# EasyEDA Pro project car_dianci.eprj

# Schematic Schematic1
Create Date: 2024-03-31; Page Name: P1; Project Name: car_dianci; Schematic Name: Schematic1; Update Date: 2024-04-11; Company: 嘉立创EDA; Page Size: A4; Version: V1.0
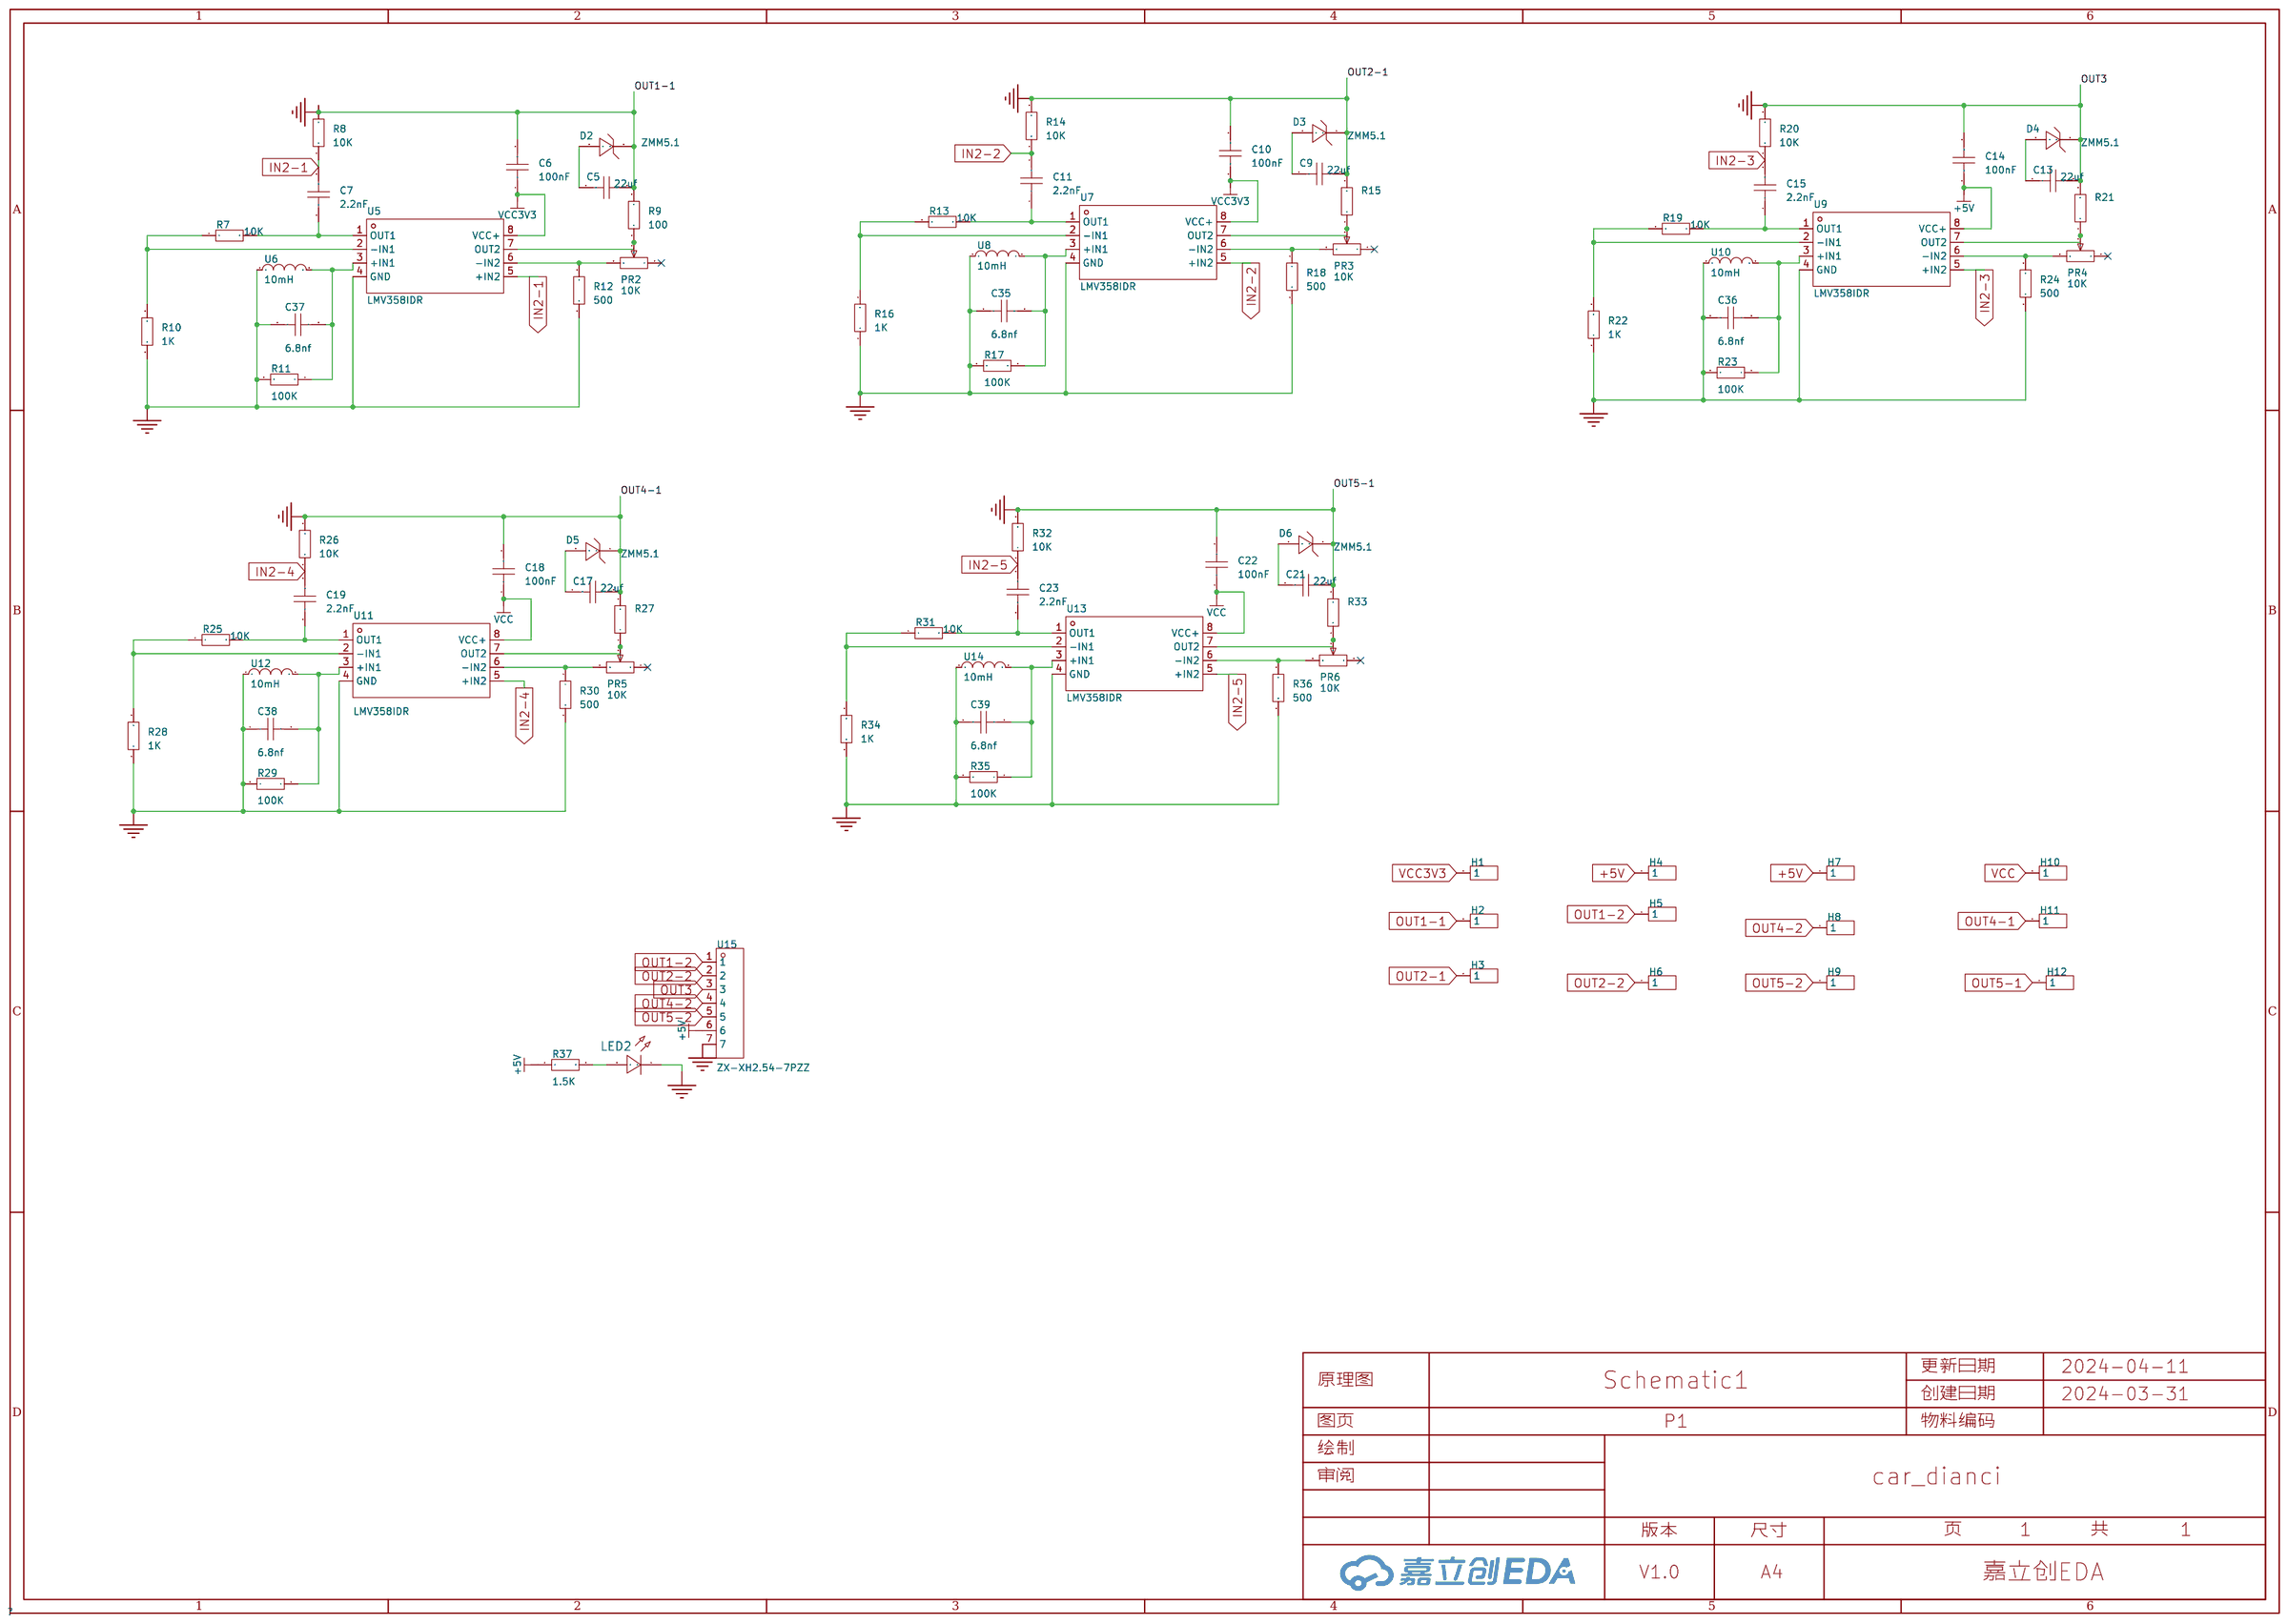
[diagram p0: schematic sheet]

## Parts
C5  22uf  [C0805]
C6  100nF  [C0805]
C7  2.2nF  [C0805]
C9  22uf  [C0805]
C10  100nF  [C0805]
C11  2.2nF  [C0805]
C13  22uf  [C0805]
C14  100nF  [C0805]
C15  2.2nF  [C0805]
C17  22uf  [C0805]
C18  100nF  [C0805]
C19  2.2nF  [C0805]
C21  22uf  [C0805]
C22  100nF  [C0805]
C23  2.2nF  [C0805]
C35  6.8nf  [CAP-TH_L7.2-W5.0-P5.00-D1.0]
C36  6.8nf  [CAP-TH_L7.2-W5.0-P5.00-D1.0]
C37  6.8nf  [CAP-TH_L7.2-W5.0-P5.00-D1.0]
C38  6.8nf  [CAP-TH_L7.2-W5.0-P5.00-D1.0]
C39  6.8nf  [CAP-TH_L7.2-W5.0-P5.00-D1.0]
D2  ZMM5.1  [SOD-80_L3.5-W1.5-RD]
D3  ZMM5.1  [SOD-80_L3.5-W1.5-RD]
D4  ZMM5.1  [SOD-80_L3.5-W1.5-RD]
D5  ZMM5.1  [SOD-80_L3.5-W1.5-RD]
D6  ZMM5.1  [SOD-80_L3.5-W1.5-RD]
H1  -  [HDR-TH_1P-V-M_XKB_X4611WV-01I-C28D40]
H2  -  [HDR-TH_1P-V-M_XKB_X4611WV-01I-C28D40]
H3  -  [HDR-TH_1P-V-M_XKB_X4611WV-01I-C28D40]
H4  -  [HDR-TH_1P-V-M_XKB_X4611WV-01I-C28D40]
H5  -  [HDR-TH_1P-V-M_XKB_X4611WV-01I-C28D40]
H6  -  [HDR-TH_1P-V-M_XKB_X4611WV-01I-C28D40]
H7  -  [HDR-TH_1P-V-M_XKB_X4611WV-01I-C28D40]
H8  -  [HDR-TH_1P-V-M_XKB_X4611WV-01I-C28D40]
H9  -  [HDR-TH_1P-V-M_XKB_X4611WV-01I-C28D40]
H10  -  [HDR-TH_1P-V-M_XKB_X4611WV-01I-C28D40]
H11  -  [HDR-TH_1P-V-M_XKB_X4611WV-01I-C28D40]
H12  -  [HDR-TH_1P-V-M_XKB_X4611WV-01I-C28D40]
LED2  -  [LED_0805]
PR2  10K  [R_3386P]
PR3  10K  [R_3386P]
PR4  10K  [R_3386P]
PR5  10K  [R_3386P]
PR6  10K  [R_3386P]
R7  10K  [R0805]
R8  10K  [R0805]
R9  100  [R0805]
R10  1K  [R0805]
R11  100K  [R0805]
R12  500  [R0805]
R13  10K  [R0805]
R14  10K  [R0805]
R15  100  [R0805]
R16  1K  [R0805]
R17  100K  [R0805]
R18  500  [R0805]
R19  10K  [R0805]
R20  10K  [R0805]
R21  100  [R0805]
R22  1K  [R0805]
R23  100K  [R0805]
R24  500  [R0805]
R25  10K  [R0805]
R26  10K  [R0805]
R27  100  [R0805]
R28  1K  [R0805]
R29  100K  [R0805]
R30  500  [R0805]
R31  10K  [R0805]
R32  10K  [R0805]
R33  100  [R0805]
R34  1K  [R0805]
R35  100K  [R0805]
R36  500  [R0805]
R37  1.5K  [R0805]
U5  LMV358IDR  [SOIC-8_L4.9-W3.9-P1.27-LS6.0-BL]
U6  10mH  [IND-TH_BD10.0-P5.00-D0.6]
U7  LMV358IDR  [SOIC-8_L4.9-W3.9-P1.27-LS6.0-BL]
U8  10mH  [IND-TH_BD10.0-P5.00-D0.6]
U9  LMV358IDR  [SOIC-8_L4.9-W3.9-P1.27-LS6.0-BL]
U10  10mH  [IND-TH_BD10.0-P5.00-D0.6]
U11  LMV358IDR  [SOIC-8_L4.9-W3.9-P1.27-LS6.0-BL]
U12  10mH  [IND-TH_BD10.0-P5.00-D0.6]
U13  LMV358IDR  [SOIC-8_L4.9-W3.9-P1.27-LS6.0-BL]
U14  10mH  [IND-TH_BD10.0-P5.00-D0.6]
U15  ZX-XH2.54-7PZZ  [CONN-TH_7P-P2.54_XH2.54-7P]

## Library data of the parts
C5-C7 C9-C11 C13-C15 C17-C19 C21-C23 = CAP_0805: Supplier Footprint: 0805
C35-C39 = MEB105J63V82CB0235: 容值:1uF;精度:±5%;额定电压:63V;介电材料:金属化聚酯;工作温度:-40℃~+110℃;; LCSC Part Name: 1uF ±5% 63V; Supplier Part: C3975271; Manufacturer: KNSCHA(科尼盛); Supplier Footprint: 插件,P=5mm; JLCPCB Part Class: 扩展库; Datasheet: https://atta.szlcsc.com/upload/public/pdf/source/20220712/44A2F3FCFA20D943DF6A492DC0D1EB3A.pdf; Supplier: LCSC; Tolerance: ±5%; Voltage Rated: 63V; Dielectric Material: 金属化聚酯; Operating Temperature: -40℃~+110℃
D2-D6 = ZMM5.1: 二极管配置:独立式;稳压值(标称值):5.1V;稳压值(范围):4.8V~5.4V;功率:500mW;精度:±5%;; Supplier Part: C212781; Manufacturer: DIOTEC(德欧泰克); Supplier Footprint: SOD-80C; JLCPCB Part Class: 扩展库; Datasheet: https://atta.szlcsc.com/upload/public/pdf/source/20180628/C212790_E7511CBF27D3FD2C34C3D8819F156467.pdf; Supplier: LCSC; Diode Configuration: 独立式; Zener Voltage (Nom): 5.1V; Reverse Leakage Current (Ir): 100nA@1V; Zener Voltage (Range): 4.8V~5.4V; Power Dissipation: 500mW; Zener Impedance (Zzt): 35Ω; Tolerance: ±5%
H1-H12 = HDR-M_2.54_1x1P: Supplier Part: C81276; Supplier Footprint: 插件; JLCPCB Part Class: Extended Part
LED2 = LED_0805-R: Supplier Footprint: 0805
PR2-PR6 = R_3386P: Supplier Footprint: 直插
R7-R37 = Res_0805: Supplier Footprint: 0805
U5 U7 U9 U11 U13 = LMV358IDR_C63813: 放大器数:双路;增益带宽积(GBP):1MHz;输入偏置电流(Ib):15nA;压摆率(SR):1V/us;带宽(-3db):-;轨到轨:-;; Supplier Part: C63813; Manufacturer: TI(德州仪器); Supplier Footprint: SOIC-8; JLCPCB Part Class: 扩展库; Datasheet: https://www.ti.com/cn/lit/gpn/lmv358; Supplier: LCSC; Number of Circuits: 双路; Gain Bandwidth Product(GBP): 1MHz; Current - Input Bias(Ib): 15nA; Slew Rate(SR): 1V/us; Output Current: 40mA; Supply Current: 210uA; Operating Temperature: -40℃~+125℃
U6 U8 U10 U12 U14 = XR8*10-101K-L: 电感值:100uH;精度:±10%;类型:工字电感;; LCSC Part Name: 100uH ±10% 工字电感; Supplier Part: C5380241; Manufacturer: XR(祥如); Supplier Footprint: 插件,D8xL10mm; JLCPCB Part Class: 扩展库; Datasheet: https://atta.szlcsc.com/upload/public/pdf/source/20230323/E8473EC4B67CAA12E996DDE863677D9C.pdf; Supplier: LCSC; Tolerance: ±10%; Type: 工字电感
U15 = ZX-XH2.54-7PZZ: 插针结构:1x7P;间距:2.54mm;安装方式:直插;参考系列:XH;总PIN数:7P;排数:1;每排PIN数:7;行距:-;额定电流:3A;触头材质:黄铜;触头镀层:锡;工作温度范围:-25℃~+85℃;; Supplier Part: C7429637; Manufacturer: Megastar(兆星); Supplier Footprint: 插件,P=2.54mm; JLCPCB Part Class: 扩展库; Datasheet: https://atta.szlcsc.com/upload/public/pdf/source/20230619/EB8CD154C1DA3F5B1470298D84E36C50.pdf; Supplier: LCSC; Pins Structure: 1x7P; Pitch: 2.54mm; Mounting Style: 直插; Reference Series: XH; Number of Pins: 7P; Number of Rows: 1; Number of PINs Per Row: 7; Current Rating (Max): 3A; Contact Material: 黄铜; Contact Plating: 锡; Operating Temperature Range: -25℃~+85℃

## Nets
+5V: C14.1 H4.1 H7.1 R37.1 U9.8(VCC+) U15.6
GND: C35.1 C36.1 C37.1 C38.1 C39.1 LED2.1(C) R10.1 R11.2 R12.2 R16.1 R17.2 R18.2 R22.1 R23.2 R24.2 R28.1 R29.2 R30.2 R34.1 R35.2 R36.2 U5.4(GND) U6.1 U7.4(GND) U8.1 U9.4(GND) U10.1 U11.4(GND) U12.1 U13.4(GND) U14.1 U15.7
VCC: C18.1 C22.1 H10.1 U11.8(VCC+) U13.8(VCC+)
VCC3V3: C6.1 C10.1 H1.1 U5.8(VCC+) U7.8(VCC+)
IN2-1: C7.2 R8.1 U5.5(+IN2)
IN2-2: C11.2 R14.1 U7.5(+IN2)
IN2-3: C15.2 R20.1 U9.5(+IN2)
IN2-4: C19.2 R26.1 U11.5(+IN2)
IN2-5: C23.2 R32.1 U13.5(+IN2)
OUT1-1: C5.2 C6.2 D2.1 H2.1 R8.2 R9.2
OUT1-2: H5.1 U15.1
OUT2-1: C9.2 C10.2 D3.1 H3.1 R14.2 R15.2
OUT2-2: H6.1 U15.2
OUT3: C13.2 C14.2 D4.1 R20.2 R21.2 U15.3
OUT4-1: C17.2 C18.2 D5.1 H11.1 R26.2 R27.2
OUT4-2: H8.1 U15.4
OUT5-1: C21.2 C22.2 D6.1 H12.1 R32.2 R33.2
OUT5-2: H9.1 U15.5
$1N3635: C5.1 D2.2
$1N3637: PR2.2 R9.1 U5.7(OUT2)
$1N3640: PR2.3 R12.1 U5.6(-IN2)
$1N3650: C7.1 R7.2 U5.1(OUT1)
$1N3654: R7.1 R10.2 U5.2(-IN1)
$1N3659: C37.2 R11.1 U5.3(+IN1) U6.2
$1N4629: C9.1 D3.2
$1N4631: PR3.2 R15.1 U7.7(OUT2)
$1N4634: PR3.3 R18.1 U7.6(-IN2)
$1N4644: C11.1 R13.2 U7.1(OUT1)
$1N4648: R13.1 R16.2 U7.2(-IN1)
$1N4653: C35.2 R17.1 U7.3(+IN1) U8.2
$1N6970: C13.1 D4.2
$1N6971: PR4.2 R21.1 U9.7(OUT2)
$1N6972: PR4.3 R24.1 U9.6(-IN2)
$1N6976: C15.1 R19.2 U9.1(OUT1)
$1N6977: R19.1 R22.2 U9.2(-IN1)
$1N6978: C36.2 R23.1 U9.3(+IN1) U10.2
$1N7413: C17.1 D5.2
$1N7414: PR5.2 R27.1 U11.7(OUT2)
$1N7415: PR5.3 R30.1 U11.6(-IN2)
$1N7419: C19.1 R25.2 U11.1(OUT1)
$1N7420: R25.1 R28.2 U11.2(-IN1)
$1N7421: C38.2 R29.1 U11.3(+IN1) U12.2
$1N7856: C21.1 D6.2
$1N7857: PR6.2 R33.1 U13.7(OUT2)
$1N7858: PR6.3 R36.1 U13.6(-IN2)
$1N7862: C23.1 R31.2 U13.1(OUT1)
$1N7863: R31.1 R34.2 U13.2(-IN1)
$1N7864: C39.2 R35.1 U13.3(+IN1) U14.2
$1N12971: LED2.2(A) R37.2

Not connected (* = marked no-connect by the designer): PR2 1*; PR3 1*; PR4 1*; PR5 1*; PR6 1*

# Board PCB1
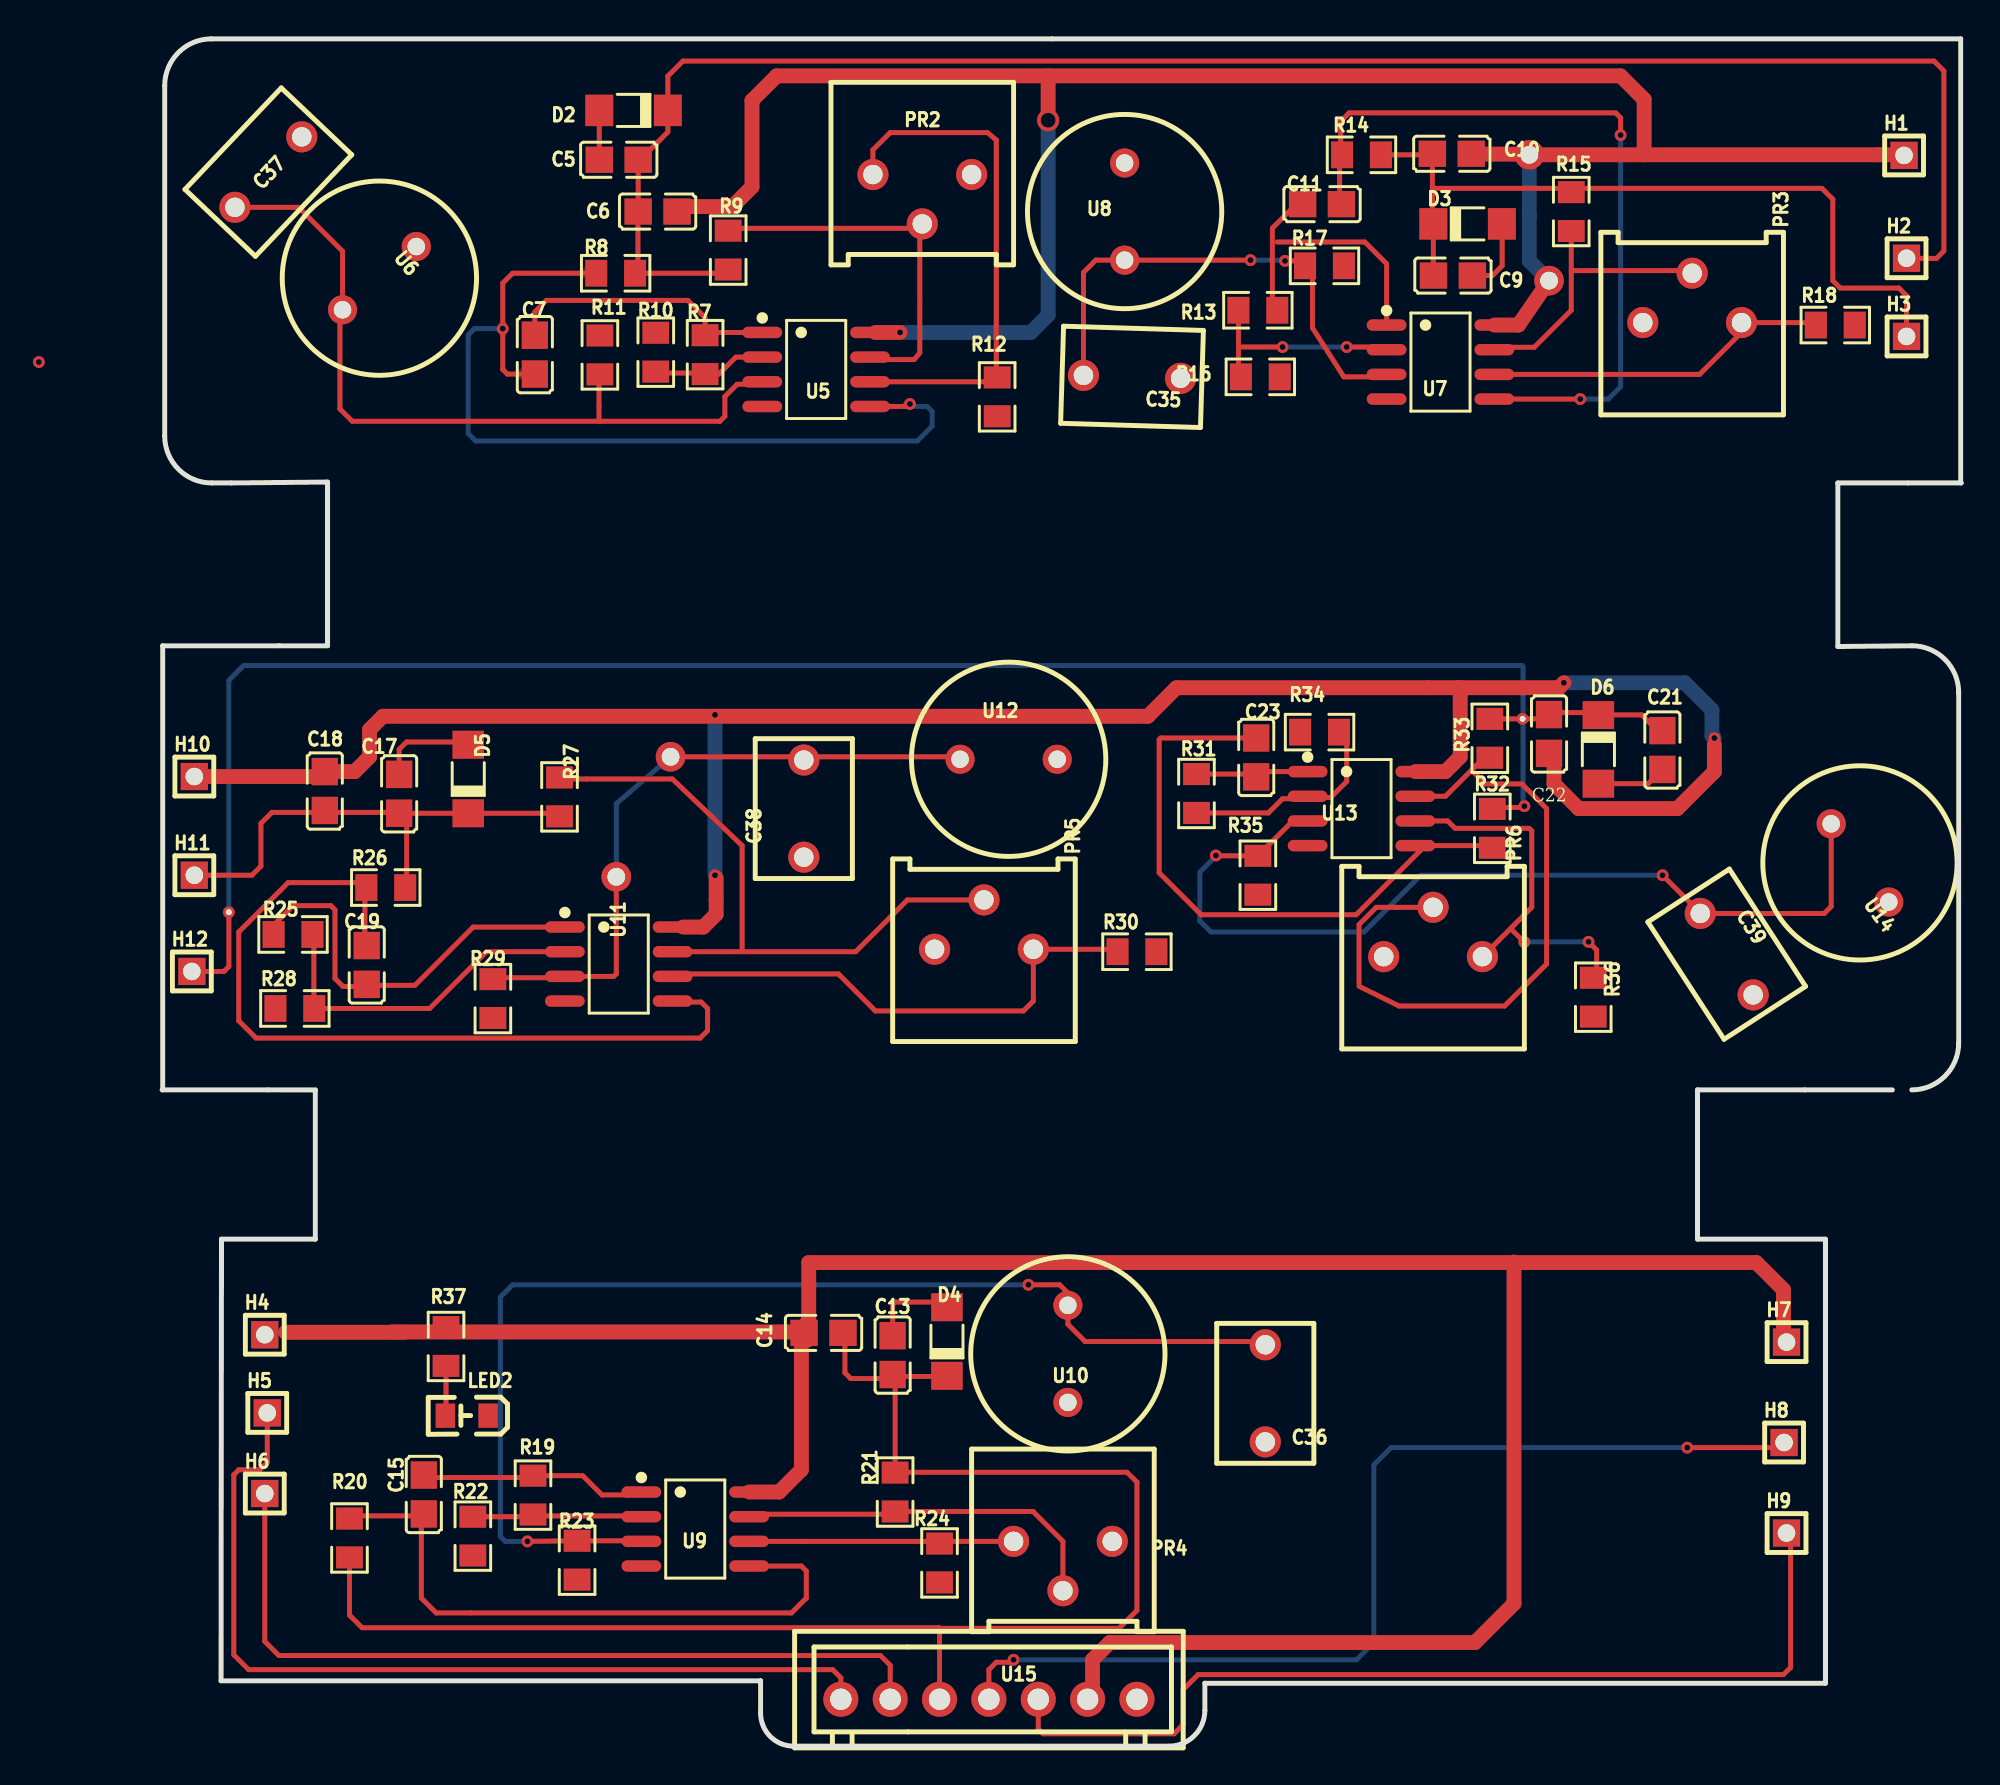
[diagram p1: board, top side]
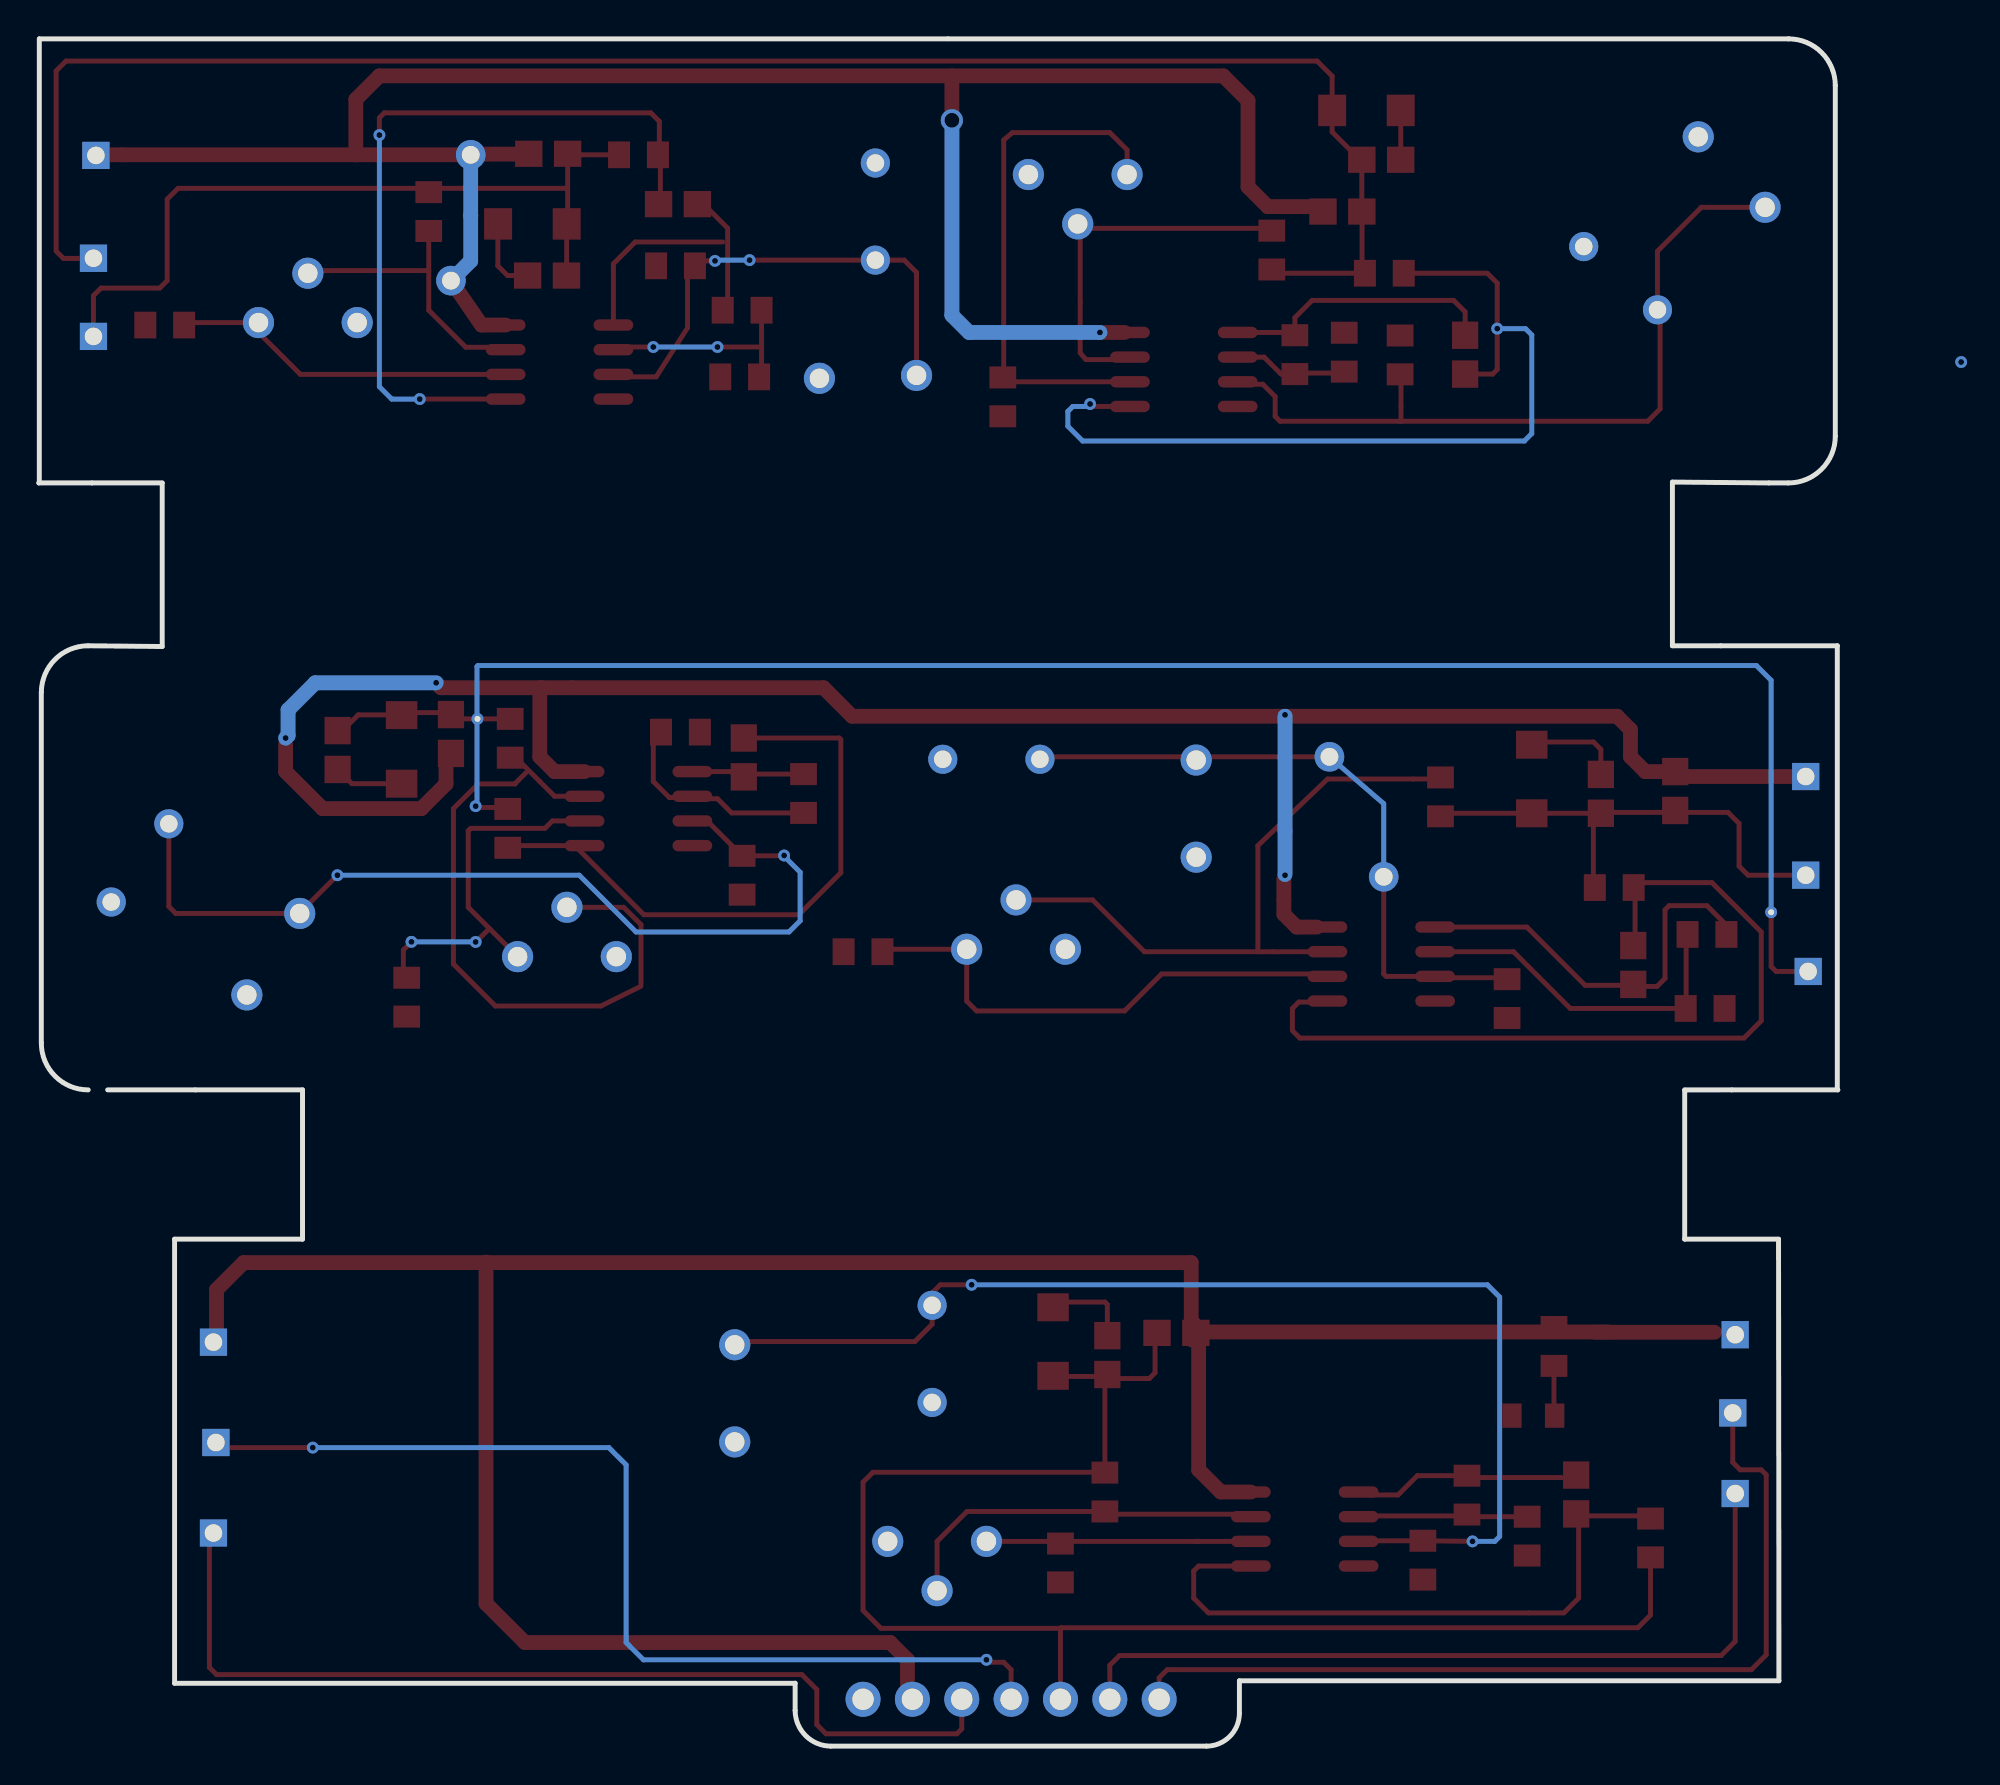
[diagram p2: board, bottom side, seen from below]

Outline 92.58 x 87.88 mm; copper layers: Top Layer, Bottom Layer. Coordinates in mm from the lower left corner of the outline.
Outline path: 89.04,33.78 79.01,33.78 79.01,26.1 85.6,26.1 85.6,3.24 53.66,3.24 53.66,1.84 arc(53.12,0.54) 51.82,0 32.49,0 arc(31.29,0.5) 30.79,1.7 30.79,3.36 3.03,3.36 3.05,26.1 7.88,26.1 7.88,33.78 5.46,33.78 0,33.78 0.02,33.81 0.02,56.64 8.51,56.64 8.51,65.07 3.54,65.02 2.54,65.02 arc(0.83,65.73) 0.13,67.44 0.13,85.48 arc(0.83,87.18) 2.53,87.88 92.56,87.88 92.56,65.05 92.58,65.02 86.24,65.02 86.24,56.6 90.05,56.64 arc(91.75,55.94) 92.46,54.23 92.46,36.19 arc(91.75,34.49) 90.04,33.78
Stack: Top Layer 0.035mm / Dielectric1 1.51mm FR4 er 4.5 / Bottom Layer 0.035mm

## Design rules (mm)
template: JLCPCB Capability(Two Layers Board)
spacing copperThickness1oz (default): track to track 0.102, other pairs 0.152 to 0.3
spacing copperThickness2oz: track to track 0.203, other pairs 0.152 to 0.3
track width copperThickness1oz (default): min 0.127, default 0.254, max 2.54
track width copperThickness2oz: min 0.203, default 0.254, max 2.54
differential pair differentialPair (default): width min 0.127, default 0.254, max 2.54; gap min 0.152, default 0.152
via viaSize (default): diameter min 0.5, default 0.61, max 10; hole min 0.3, default 0.305, max 6.3

## Placement (name value [footprint] x y rotation side)
C5  22uf  [C0805]  23.5 81.66 0 top
C6  100nF  [C0805]  25.5 78.99 180 top
C7  2.2nF  [C0805]  19.18 71.63 270 top
C9  22uf  [C0805]  66.43 75.7 180 top
C10  100nF  [C0805]  66.37 81.97 180 top
C11  2.2nF  [C0805]  59.69 79.37 0 top
C13  22uf  [C0805]  37.59 20.13 270 top
C14  100nF  [C0805]  34.04 21.27 0 top
C15  2.2nF  [C0805]  13.46 12.95 270 top
C17  22uf  [C0805]  12.19 49.02 270 top
C18  100nF  [C0805]  8.37 49.16 270 top
C19  2.2nF  [C0805]  10.53 40.21 90 top
C21  22uf  [C0805]  77.21 51.28 90 top
C22  100nF  [C0805]  71.37 52.1 90 top
C23  2.2nF  [C0805]  56.3 50.89 90 top
C35  6.8nf  [CAP-TH_L7.2-W5.0-P5.00-D1.0]  49.91 70.48 178.3 top
C36  6.8nf  [CAP-TH_L7.2-W5.0-P5.00-D1.0]  56.77 18.16 90 top
C37  6.8nf  [CAP-TH_L7.2-W5.0-P5.00-D1.0]  5.46 81.03 226.5 top
C38  6.8nf  [CAP-TH_L7.2-W5.0-P5.00-D1.0]  33.02 48.26 90 top
C39  6.8nf  [CAP-TH_L7.2-W5.0-P5.00-D1.0]  80.52 40.77 123 top
D2  ZMM5.1  [SOD-80_L3.5-W1.5-RD]  24.26 84.2 180 top
D3  ZMM5.1  [SOD-80_L3.5-W1.5-RD]  67.18 78.36 0 top
D4  ZMM5.1  [SOD-80_L3.5-W1.5-RD]  40.39 20.83 90 top
D5  ZMM5.1  [SOD-80_L3.5-W1.5-RD]  15.75 49.78 90 top
D6  ZMM5.1  [SOD-80_L3.5-W1.5-RD]  73.91 51.31 270 top
H1  -  [HDR-TH_1P-V-M_XKB_X4611WV-01I-C28D40]  89.65 81.88 0 top
H2  -  [HDR-TH_1P-V-M_XKB_X4611WV-01I-C28D40]  89.77 76.59 0 top
H3  -  [HDR-TH_1P-V-M_XKB_X4611WV-01I-C28D40]  89.77 72.57 0 top
H4  -  [HDR-TH_1P-V-M_XKB_X4611WV-01I-C28D40]  5.28 21.18 0 top
H5  -  [HDR-TH_1P-V-M_XKB_X4611WV-01I-C28D40]  5.41 17.15 0 top
H6  -  [HDR-TH_1P-V-M_XKB_X4611WV-01I-C28D40]  5.28 13 0 top
H7  -  [HDR-TH_1P-V-M_XKB_X4611WV-01I-C28D40]  83.6 20.8 0 top
H8  -  [HDR-TH_1P-V-M_XKB_X4611WV-01I-C28D40]  83.47 15.63 0 top
H9  -  [HDR-TH_1P-V-M_XKB_X4611WV-01I-C28D40]  83.6 10.97 0 top
H10  -  [HDR-TH_1P-V-M_XKB_X4611WV-01I-C28D40]  1.65 49.91 0 top
H11  -  [HDR-TH_1P-V-M_XKB_X4611WV-01I-C28D40]  1.65 44.83 0 top
H12  -  [HDR-TH_1P-V-M_XKB_X4611WV-01I-C28D40]  1.52 39.88 0 top
LED2  -  [LED_0805]  15.62 17.02 180 top
NOREF  -  [Pad_e424]  70.01 52.88 0 top
NOREF#2  -  [Pad_e158]  23.37 44.75 0 top
NOREF#3  -  [Pad_e236]  70.36 81.91 0 top
NOREF#4  -  [Pad_e159]  26.16 50.93 0 top
NOREF#5  -  [Pad_e238]  71.37 75.44 0 top
NOREF#6  -  [Pad_e425]  3.43 42.93 0 top
PR2  10K  [R_3386P]  39.12 80.9 90 top
PR3  10K  [R_3386P]  78.74 73.28 270 top
PR4  10K  [R_3386P]  46.35 10.54 90 top
PR5  10K  [R_3386P]  42.29 41.02 270 top
PR6  10K  [R_3386P]  65.41 40.64 270 top
R7  10K  [R0805]  27.94 71.63 90 top
R8  10K  [R0805]  23.34 75.82 0 top
R9  100  [R0805]  29.13 77.01 270 top
R10  1K  [R0805]  25.4 71.75 270 top
R11  100K  [R0805]  22.52 71.61 90 top
R12  500  [R0805]  42.97 69.45 270 top
R13  10K  [R0805]  56.39 73.91 0 top
R14  10K  [R0805]  61.72 81.91 0 top
R15  100  [R0805]  72.52 78.99 90 top
R16  1K  [R0805]  56.52 70.48 180 top
R17  100K  [R0805]  59.82 76.2 0 top
R18  500  [R0805]  86.11 73.15 0 top
R19  10K  [R0805]  19.08 12.92 90 top
R20  10K  [R0805]  9.64 10.72 270 top
R21  100  [R0805]  37.72 13.08 90 top
R22  1K  [R0805]  15.99 10.81 90 top
R23  100K  [R0805]  21.35 9.57 270 top
R24  500  [R0805]  40 9.43 270 top
R25  10K  [R0805]  6.73 41.78 180 top
R26  10K  [R0805]  11.5 44.2 0 top
R27  100  [R0805]  20.45 48.86 270 top
R28  1K  [R0805]  6.83 37.97 0 top
R29  100K  [R0805]  17.02 38.48 270 top
R30  500  [R0805]  50.16 40.89 0 top
R31  10K  [R0805]  53.23 49.04 90 top
R32  10K  [R0805]  68.45 47.24 90 top
R33  100  [R0805]  68.33 51.88 90 top
R34  1K  [R0805]  59.56 52.2 0 top
R35  100K  [R0805]  56.39 44.83 270 top
R36  500  [R0805]  73.65 38.55 270 top
R37  1.5K  [R0805]  14.61 20.57 270 top
U5  LMV358IDR  [SOIC-8_L4.9-W3.9-P1.27-LS6.0-BL]  33.66 70.87 270 top
U6  10mH  [IND-TH_BD10.0-P5.00-D0.6]  11.18 75.56 220.6 top
U7  LMV358IDR  [SOIC-8_L4.9-W3.9-P1.27-LS6.0-BL]  65.79 71.25 270 top
U8  10mH  [IND-TH_BD10.0-P5.00-D0.6]  49.53 78.99 270 top
U9  LMV358IDR  [SOIC-8_L4.9-W3.9-P1.27-LS6.0-BL]  27.43 11.18 270 top
U10  10mH  [IND-TH_BD10.0-P5.00-D0.6]  46.61 20.19 90 top
U11  LMV358IDR  [SOIC-8_L4.9-W3.9-P1.27-LS6.0-BL]  23.5 40.26 270 top
U12  10mH  [IND-TH_BD10.0-P5.00-D0.6]  43.56 50.8 180 top
U13  LMV358IDR  [SOIC-8_L4.9-W3.9-P1.27-LS6.0-BL]  61.72 48.26 270 top
U14  10mH  [IND-TH_BD10.0-P5.00-D0.6]  87.38 45.47 126.4 top
U15  ZX-XH2.54-7PZZ  [CONN-TH_7P-P2.54_XH2.54-7P]  42.54 2.41 180 top

## Footprints (pads in the part's own frame, mm; a bottom-side part is the same pattern mirrored in y, then rotated)
C0805
  rect 1.41x1.35 smd: 1(-1,0) 2(1,0)
CAP-TH_L7.2-W5.0-P5.00-D1.0
  round 1.6 hole 1: 1(-2.5,0) 2(2.5,0)
CONN-TH_7P-P2.54_XH2.54-7P
  round 1.8 hole 1.1: 1(7.62,0) 2(5.08,0) 3(2.54,0) 4(0,0) 5(-2.54,0) 6(-5.08,0) 7(-7.62,0)
HDR-TH_1P-V-M_XKB_X4611WV-01I-C28D40
  rect 1.4x1.4 hole 0.9: 1(0,0)
IND-TH_BD10.0-P5.00-D0.6
  round 1.5 hole 0.9: 1(-2.5,0) 2(2.5,0)
LED_0805
  rect 1x1.25 smd: 1(-1.15,0.005) 2(1.05,0.005)
Pad_e158
  round 1.524 hole 0.914: 9(0,0)
Pad_e159
  round 1.524 hole 0.914: 10(0,0)
Pad_e236
  round 1.524 hole 0.914: 11(0,0)
Pad_e238
  round 1.524 hole 0.914: 12(0,0)
Pad_e424
  round 0.61 hole 0.305: 13(0,0)
Pad_e425
  round 0.61 hole 0.305: 14(0,0)
R0805
  rect 1.133x1.377 smd: 1(-1,0) 2(1,0)
R_3386P
  round 1.6 hole 1.001: 1(0,-2.54) 2(-2.54,0) 3(0,2.54)
SOD-80_L3.5-W1.5-RD
  rect 1.44x1.62 smd: 1(-1.765,0) 2(1.765,0)
SOIC-8_L4.9-W3.9-P1.27-LS6.0-BL
  oval 0.588x2.045 smd: 1(-1.905,-2.772) 2(-0.635,-2.772) 3(0.635,-2.772) 4(1.905,-2.772) 5(1.905,2.772) 6(0.635,2.772) 7(-0.635,2.772) 8(-1.905,2.772)

## Nets
As in the schematic, except:
VCC3V3: C6.1 C10.1 H1.1 NOREF#3.11 NOREF#5.12 U5.8 U7.8
OUT5-1: C21.2 C22.2 D6.1 H12.1 NOREF.13 NOREF#6.14 R32.2 R33.2
$1N7421: C38.2 NOREF#2.9 NOREF#4.10 R29.1 U11.3 U12.2

Pads without a net: PR2 1; PR3 1; PR4 1; PR5 1; PR6 1

## Via types
v1: diameter 0.61, hole 0.305, Top Layer to Bottom Layer, 23 vias
v2: diameter 1.143, hole 0.762, Top Layer to Bottom Layer, 1 via

## Routing (per net, layer and track width the routed paths; a pad name or vN(x,y) marks a point on that pad's centre or on a via; arc(x,y) is an arc through that point)
VCC: length 113.8
  Top Layer w0.762: H10.1 8.11,49.91 C18.1 9.91,50.16 10.67,50.93 10.67,52.32 11.36,53.01 50.73,53.01 52.2,54.48 66.68,54.48 66.8,54.36 ; 26.81,42.16 27.85,42.16 28.51,42.82 28.51,44.69 ; U13.8 66.04,50.16 66.8,50.93 66.8,54.48 71.88,54.48 v1(72.14,54.74) ; 71.35,51.05 71.63,50.78 71.63,49.53 72.9,48.26 77.98,48.26 79.88,50.16 79.88,51.56
  Bottom Layer w0.762: 28.45,53.01 28.45,44.87 ; v1(72.14,54.74) 78.36,54.74 79.76,53.34 79.76,52.02 v1(79.88,51.89)
  vias: v1(28.45,53.09) v1(28.45,44.83)
VCC3V3:
  vias: v1(37.97,72.77) v2(45.59,83.69)
(no net):
  vias: v1(-6.35,71.25)
IN2-1: length 46.7
  Top Layer w0.254: R8.1 18.03,75.82 17.53,75.31 v1(17.53,72.97) 17.53,70.87 17.76,70.63 C7.2 ; U5.5 38.35,68.96 v1(38.48,69.09)
  Bottom Layer w0.254: v1(17.53,72.97) 16.07,72.97 15.75,72.64 15.75,67.56 16.13,67.18 38.86,67.18 39.62,67.94 39.62,68.71 39.37,68.96 38.48,68.96
IN2-2: length 39.5
  Top Layer w0.254: 60.59,82.04 60.59,79.36 60.71,79.25 60.96,79.25 ; 60.65,81.91 60.65,83.64 61.09,84.07 74.8,84.07 75.06,83.82 v1(75.06,82.93) ; 69.22,69.47 69.34,69.34 v1(72.98,69.34)
  Bottom Layer w0.254: v1(72.98,69.34) 74.42,69.34 75.06,69.98 v1(75.06,82.93)
OUT4-2: length 52.1
  Top Layer w0.254: U15.4 42.54,3.94 42.93,4.32 43.69,4.32 v1(43.81,4.44) ; 83.19,15.37 v1(78.49,15.37)
  Bottom Layer w0.254: 43.94,4.44 61.47,4.44 62.36,5.33 62.36,14.48 63.25,15.37 v1(78.49,15.37)
OUT5-1:
  vias: v1(70.1,48.39)
$1N4648: length 11.2
  Top Layer w0.254: R13.1 55.39,70.6 55.5,70.48 ; 55.39,72.02 v1(57.66,72.02) ; v1(60.96,72.02) 62.87,72.02 U7.2
  Bottom Layer w0.254: v1(57.66,72.02) v1(60.96,72.02)
$1N4653: length 25.9
  Top Layer w0.254: C35.2 47.41,75.86 48.05,76.49 U8.2 v1(56.01,76.49) ; v1(57.78,76.45) 58.56,76.45 R17.1 ; 59.2,76.07 59.2,73.01 60.81,70.48 63.59,70.48
  Bottom Layer w0.254: v1(56.01,76.49) 57.75,76.49 v1(57.78,76.45)
$1N6978: length 61.5
  Top Layer w0.254: v1(18.8,10.54) R23.1 24.35,10.57 24.38,10.54 ; v1(44.58,23.75) 46.19,23.75 46.61,23.33 46.61,22.3 ; U10.2 46.61,21.72 47.5,20.83 56.52,20.83 56.64,20.95
  Bottom Layer w0.254: v1(44.58,23.75) 18.03,23.75 17.4,23.12 17.4,10.79 17.65,10.54 v1(18.8,10.54)
$1N7858: length 19.4
  Top Layer w0.254: 65,47.62 66.16,47.62 66.54,47.24 70.36,47.24 70.49,47.12 70.49,43.18 PR6.3 ; 69.39,42.09 69.95,41.53 69.98,41.53 ; v1(73.41,41.4) 73.82,40.98 73.82,39.63
  Bottom Layer w0.254: v1(70.1,41.4) 70.11,41.4 73.53,41.4
$1N7864: length 48.9
  Top Layer w0.254: v1(54.23,45.85) 54.25,45.83 R35.1 58.18,47.62 59.46,47.62 ; v1(77.22,44.83) 79.16,42.89 C39.2 85.54,42.86 85.89,43.22 85.89,47.48
  Bottom Layer w0.254: v1(54.23,45.85) 54.23,45.81 53.4,44.99 53.4,42.48 53.97,41.91 61.85,41.91 64.77,44.83 v1(77.22,44.83)
+5V: length 137.6
  Top Layer w0.254: 11.67,21.18 11.81,21.32
  Top Layer w0.762: 6.35,21.3 12.49,21.3 ; 11.81,21.32 32.83,21.32 33.24,20.91 ; U9.8 31.75,13.08 32.89,14.22 32.89,20.95 33.02,21.08 ; 32.83,21.45 33.27,21.89 33.27,24.89 82.04,24.89 83.44,23.49 83.44,20.83 83.57,20.7 ; 47.62,2.69 47.88,2.95 47.88,4.44 48.77,5.33 67.56,5.33 69.57,7.34 69.57,24.92
IN2-3: length 33.3
  Top Layer w0.254: 9.38,11.84 9.39,11.85 13.48,11.85 13.34,11.71 13.34,7.62 14.1,6.86 32.38,6.86 33.15,7.62 33.15,9.02 32.89,9.27 U9.5
IN2-4: length 42.2
  Top Layer w0.254: 10.03,44.45 6.48,44.45 3.94,41.91 3.94,37.34 4.83,36.45 27.69,36.45 28,36.77 ; 10.43,44.2 10.43,41.31 C19.2 ; 26.47,38.3 27.74,38.3 28.07,37.97 28.07,36.83
IN2-5: length 31.5
  Top Layer w0.254: C23.2 51.39,51.89 51.31,51.82 51.31,44.96 53.47,42.8 61.45,42.8 65,46.35 68.27,46.35 68.45,46.17
OUT1-1: length 93.4
  Top Layer w0.254: 24.51,79.12 24.48,79.09 24.48,75.82 29.08,75.82 29.21,75.95 ; C5.2 24.5,79.34 24.47,78.69 ; 26.02,84.33 26.02,85.97 26.8,86.74 91.19,86.74 91.69,86.23 91.69,76.96 91.31,76.58 89.91,76.58 89.77,76.72 ; D2.1 26.02,83.09 24.59,81.66
OUT1-2: length 46.3
  Top Layer w0.254: 5.41,16.81 5.41,14.61 5.02,14.22 3.94,14.22 3.68,13.97 3.68,4.7 4.45,3.94 34.51,3.94 34.93,3.52 U15.1
OUT2-1: length 40.2
  Top Layer w0.254: 62.8,81.91 65.31,81.91 C10.2 65.37,78.41 D3.1 65.42,75.94 65.17,75.7 ; 65.37,80.19 85.42,80.19 85.98,79.63 85.98,75.44 86.36,75.06 89.38,75.06 89.77,74.66 H3.1
OUT2-2: length 42.1
  Top Layer w0.254: H6.1 5.28,5.39 6,4.66 36.97,4.66 37.47,4.16 U15.2
OUT3: length 79.2
  Top Layer w0.254: 9.64,9.64 9.64,6.75 10.29,6.1 39.97,6.1 40.01,6.07 40.01,2.17 ; C14.2 35.14,21.17 35.14,19.22 35.43,18.92 37.8,18.92 ; 37.72,14.41 37.72,19.03 40.35,19.03 D4.1 ; 37.97,14.08 37.99,14.1 49.66,14.1 50.16,13.59 50.16,6.98 49.25,6.07 39.95,6.07
OUT4-1: length 25.6
  Top Layer w0.254: H11.1 4.62,44.83 5.08,45.29 5.08,47.5 5.65,48.06 12.15,48.06 ; 12.15,48.06 C17.2 15.75,48.02 D5.1 20.29,48.02 R27.2 ; 12.15,48.06 12.58,47.64 12.58,44.2
OUT5-2: length 49.7
  Top Layer w0.254: U15.5 45.09,0.89 45.34,0.63 52.07,0.63 52.54,1.11 52.54,2.91 53.31,3.68 83.44,3.68 83.81,4.05 83.81,10.97
$1N3635: length 2.5
  Top Layer w0.254: D2.2 22.49,81.67 22.48,81.66
$1N3637: length 19.3
  Top Layer w0.254: 29,78.13 38.89,78.13 38.99,78.23 ; 36.58,71.37 38.7,71.37 38.99,71.72 38.99,78.23 ; 38.99,78.23 PR2.2
$1N3640: length 26.4
  Top Layer w0.254: PR2.3 36.58,82.17 37.47,83.06 42.47,83.06 42.93,82.68 42.93,70.5 R12.1 42.75,70.23 37.03,70.23
$1N3650: length 13.9
  Top Layer w0.254: 19.18,72.68 19.18,73.83 19.77,74.42 27.05,74.42 27.94,73.53 27.94,72.64 28.07,72.77 30.41,72.77
$1N3654: length 5.2
  Top Layer w0.254: 25.81,70.68 27.89,70.68 R7.1 28.65,70.63 29.52,71.5 30.61,71.5
$1N3659: length 40.3
  Top Layer w0.254: C37.2 7.02,79.21 9.28,76.95 U6.2 9.14,73.8 9.14,68.83 9.78,68.2 22.53,68.2 ; 22.72,70.54 22.48,70.3 22.48,68.2 28.7,68.2 28.96,68.45 28.96,69.47 29.59,70.1 30.48,70.1 30.61,70.23
$1N4629: length 3.9
  Top Layer w0.254: C9.1 68.46,75.7 68.96,76.2 68.96,78.35 68.95,78.36
$1N4631: length 15.2
  Top Layer w0.254: U7.7 68.69,72.01 70.61,72.01 72.52,73.91 R15.1 ; 72.52,75.95 78.6,75.95 PR3.2
$1N4634: length 17.9
  Top Layer w0.254: U7.6 79.12,70.61 81.28,72.77 PR3.3 85.03,73.28
$1N4644: length 15.2
  Top Layer w0.254: 58.39,79.39 57.13,78.14 57.13,73.91 ; 57.39,77.43 61.89,77.43 63.01,76.31 U7.1
$1N6970: length 4.4
  Top Layer w0.254: C13.1 37.59,22.73 37.72,22.86 40.39,22.86
$1N6971: length 18.9
  Top Layer w0.254: 30.73,11.94 37.58,11.94 R21.1 44.81,12.08 46.35,10.54 PR4.2
$1N6972: length 13.8
  Top Layer w0.254: 30.61,10.54 33.09,10.54 ; 32.84,10.54 43.75,10.54 44,10.29
$1N6976: length 10.3
  Top Layer w0.254: 14.19,13.83 18.99,13.83 R19.2 21.64,13.92 22.63,12.93 24.03,12.93
$1N6977: length 8.2
  Top Layer w0.254: R22.2 19.08,11.81 ; 19.08,11.85 24.2,11.85
$1N7413: length 4.8
  Top Layer w0.254: C17.1 12.19,51.31 12.57,51.69 15.37,51.69 15.49,51.56
$1N7414: length 33.2
  Top Layer w0.254: 20.65,49.78 26.26,49.78 29.84,46.35 29.84,40.89 ; U11.7 35.69,40.89 38.35,43.56 PR5.2
$1N7415: length 26.2
  Top Layer w0.254: 26.8,39.75 34.8,39.75 36.7,37.85 44.32,37.85 44.83,38.35 PR5.3 49.15,41.02 49.28,40.89
$1N7419: length 20.9
  Top Layer w0.254: R25.2 5.73,42.26 6.73,43.26 8.68,43.26 8.89,43.05 8.89,39.52 9.3,39.11 10.3,39.11 10.41,38.99 ; 10.53,39.16 13,39.16 16,42.16 U11.1
$1N7420: length 17.7
  Top Layer w0.254: 7.8,41.78 7.8,38 R28.2 13.77,37.97 16.69,40.89 20.45,40.89
$1N7856: length 3.6
  Top Layer w0.254: D6.2 76.47,49.54 C21.1
$1N7857: length 34.7
  Top Layer w0.254: 61.59,39.24 61.59,42.29 62.48,43.18 63.5,43.18 ; 63.41,43.18 65.53,43.18 ; 61.59,39.12 63.65,38.1 69.09,38.1 71.25,40.26 71.25,48.26 69.98,49.53 68.07,49.53 68.07,49.55 67.51,50.11 ; 65,48.89 66.04,48.89 68.1,50.95
$1N7862: length 6
  Top Layer w0.254: R31.2 55.88,50.04 56.13,49.78 ; 56.64,49.85 56.96,50.16 59.46,50.16
$1N7863: length 11.2
  Top Layer w0.254: R31.1 56.93,48.04 57.66,48.77 59.33,48.77 59.46,48.89 ; 59.39,48.83 60.13,48.83 60.96,49.66 60.96,51.8 R34.2
$1N12971: length 2.5
  Top Layer w0.254: 14.61,19.5 14.61,17.01

## Copper pours and planes (outline as drawn; the poured copper is in the pictures)
GND on Top Layer: -3.05,87.88 95.38,87.88 95.38,1.4 -3.05,1.4
GND on Bottom Layer: -5.21,90.55 107.57,90.55 107.57,0.76 -5.21,0.76

Small or netless copper shapes (teardrops, artwork), in the pictures only: 6 on Top Layer
